# Altium schematic sheet Power.SchDoc
size A4; SheetNumber: 3; SheetTotal: 7
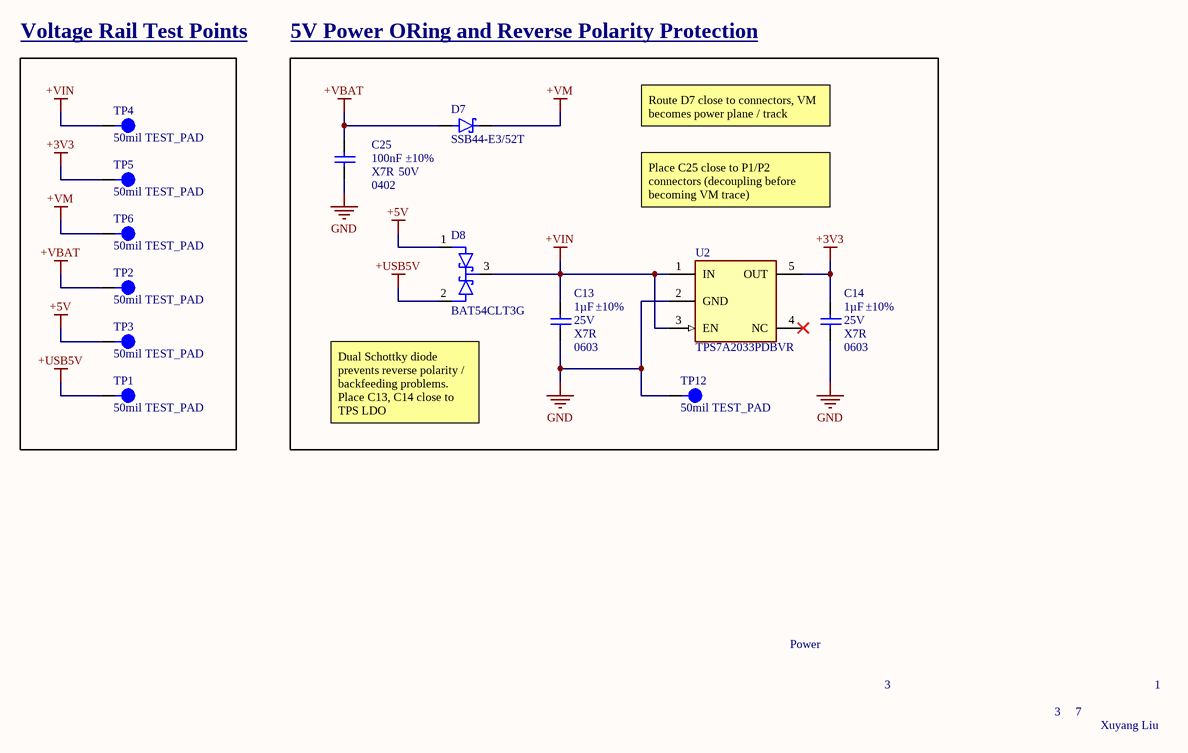
[diagram p0: Power.SchDoc]

## Parts
C13  Voltage: 25V  Tolerance: ±10%  Dielectric: X7R  Case/Package: 0603  Capacitance: 1µF  [0603_CAP]  (hidden comment: 1uF)
C14  Voltage: 25V  Tolerance: ±10%  Dielectric: X7R  Case/Package: 0603  Capacitance: 1µF  [0603_CAP]  (hidden comment: 1uF)
C25  Case/Package: 0402  Voltage Rating: 50V  Dielectric: X7R  Tolerance: ±10%  [0402_Cap]  (hidden comment: 100nF)
D7  SSB44-E3/52T  [DIODE_DO214AA_MBRS_VIS-M]
D8  BAT54CLT3G  [ONSC-SOT-23-3-318-08_V]
TP1  50mil TEST_PAD  [15mil_TEST_PAD]
TP2  50mil TEST_PAD  [15mil_TEST_PAD]
TP3  50mil TEST_PAD  [15mil_TEST_PAD]
TP4  50mil TEST_PAD  [15mil_TEST_PAD]
TP5  50mil TEST_PAD  [15mil_TEST_PAD]
TP6  50mil TEST_PAD  [15mil_TEST_PAD]
TP12  50mil TEST_PAD  [15mil_TEST_PAD]
U2  TPS7A2033PDBVR  [FP-DBV0005A-MFG]

## Blocks framed on the sheet
Voltage Rail Test Points: TP1-TP6
5V Power ORing and Reverse Polarity Protection: C13 C14 C25 D7 D8 TP12 U2

## Nets
+3V3: C14.2 TP5.1 U2.5(OUT)
+5V: D8.1(A1) TP3.1
+USB5V: D8.2(A2) TP1.1
+VBAT: C25.2 D7.A TP2.1
+VIN: C13.2 D8.3(K) TP4.1 U2.1(IN) U2.3(EN)
+VM: D7.C TP6.1
GND: C13.1 C14.1 C25.1 TP12.1 U2.2(GND)

Not connected (* = marked no-connect by the designer): U2 4(NC)*

## Notes on the sheet
- Route D7 close to connectors, VM becomes power plane / track
- Place C25 close to P1/P2 connectors (decoupling before becoming VM trace)
- (near D8) Dual Schottky diode prevents reverse polarity / backfeeding problems. Place C13, C14 close to TPS LDO
- Power
- 3
- 3     7
- 1
- Xuyang Liu

## Library data of the parts
C13 C14 = GCM188R71E105KA64D: 25V 1uF X7R ±10% 0603 Multilayer Ceramic Capacitors MLCC - SMD/SMT ROHS; Manufacturer: Murata; Manufacturer Lifecycle Status: IN PRODUCTION; Supplier 1: DigiKey; Manufacturer Part Number: GCM188R71E105KA64D; RoHS: Compliant; Category: Ceramic Capacitors; Stock 1: 751115; Pricing 1: 1=0.19, 10=0.106, 50=0.0752, 100=0.0658, 500=0.04994, 1000=0.04504 (USD); Case Code (Imperial): 0603; Case Code (Metric): 1608; Country of Origin: Philippines; Depth: 800µm; Dielectric Material: Ceramic; Export Control Classification Number (ECCN) Code: EAR99; Height: 800µm; Harmonized Tariff Schedule (HTS) Code: 8532.24.00.20; Introduction Date: 2010-10-29; Lead Free: Lead Free; Length: 1.6mm; Lifecycle Status: Production; Material: Ceramic; Max Operating Temperature: 125°C; Min Operating Temperature: -55°C; Mount: Surface Mount; Number of Terminals: 2; Packaging: Cut Tape; Radiation Hardening: No; Ratings: AEC-Q200; REACH SVHC: Yes; Schedule B: 8532240020, 8532240020|8532240020, 8532240020|8532240020|8532240020, 8532240020|8532240020|8532240020|8532240020; Termination: SMD/SMT; Voltage Rating: 25V; Voltage Rating (DC): 25V; Weight: 6.293594mg; Width: 800µm; ComponentLink1URL: https://datasheet.octopart.com:443/GCM188R71E105KA64D-Murata-datasheet-39128443.pdf?src-supplier=Newark; ComponentLink1Description: https://datasheet.octopart.com:443/GCM188R71E105KA64D-Murata-datasheet-39128443.pdf?src-supplier=Newark; ComponentLink2URL: https://datasheet.octopart.com:443/GCM188R71E105KA64D-Murata-datasheet-62316951.pdf?src-supplier=element14+APAC; ComponentLink2Description: https://datasheet.octopart.com:443/GCM188R71E105KA64D-Murata-datasheet-62316951.pdf?src-supplier=element14+APAC; ComponentLink3URL: https://datasheet.octopart.com:443/GCM188R71E105KA64D-Murata-datasheet-141267554.pdf?src-supplier=Geoflip; ComponentLink3Description: https://datasheet.octopart.com:443/GCM188R71E105KA64D-Murata-datasheet-141267554.pdf?src-supplier=Geoflip; ComponentLink4URL: https://datasheet.octopart.com:443/GCM188R71E105KA64D-Murata-datasheet-140658666.pdf?src-supplier=Ciiva; ComponentLink4Description: https://datasheet.octopart.com:443/GCM188R71E105KA64D-Murata-datasheet-140658666.pdf?src-supplier=Ciiva; ComponentLink5URL: https://datasheet.octopart.com:443/GCM188R71E105KA64D-Murata-datasheet-138718232.pdf?src-supplier=Ciiva; ComponentLink5Description: https://datasheet.octopart.com:443/GCM188R71E105KA64D-Murata-datasheet-138718232.pdf?src-supplier=Ciiva; ComponentLink6URL: https://datasheet.octopart.com:443/GCM188R71E105KA64D-Murata-datasheet-81455541.pdf?src-supplier=TME; ComponentLink6Description: https://datasheet.octopart.com:443/GCM188R71E105KA64D-Murata-datasheet-81455541.pdf?src-supplier=TME; ComponentLink7URL: https://datasheet.octopart.com/GCM188R71E105KA64D-Murata-datasheet-14404430.pdf; ComponentLink7Description: https://datasheet.octopart.com/GCM188R71E105KA64D-Murata-datasheet-14404430.pdf; ComponentLink8URL: https://datasheet.octopart.com:443/GCM188R71E105KA64D-Murata-datasheet-14393380.pdf?src-supplier=Future+Electronics; ComponentLink8Description: https://datasheet.octopart.com:443/GCM188R71E105KA64D-Murata-datasheet-14393380.pdf?src-supplier=Future+Electronics; ComponentLink9URL: https://datasheet.octopart.com:443/GCM188R71E105KA64D-Murata-datasheet-44103482.pdf?src-supplier=Future+Electronics; ComponentLink9Description: https://datasheet.octopart.com:443/GCM188R71E105KA64D-Murata-datasheet-44103482.pdf?src-supplier=Future+Electronics; ComponentLink10URL: http://sigma.octopart.com:80/reach_statement/Murata-company-16.pdf?src-supplier=Compliance+Statements; ComponentLink10Description: http://sigma.octopart.com:80/reach_statement/Murata-company-16.pdf?src-supplier=Compliance+Statements; Supplier Part Number 1: 490-10673-1-ND
C25 = GCM155R71H104KE02J: 50V 100nF X7R ±10% 0402 Multilayer Ceramic Capacitors MLCC - SMD/SMT ROHS; Manufacturer: Murata; Manufacturer Lifecycle Status: IN PRODUCTION; Supplier 1: DigiKey; Manufacturer Part Number: GCM155R71H104KE02J; RoHS: Compliant; Category: Ceramic Capacitors; Stock 1: 13930662; Pricing 1: 1=0.1, 10=0.034, 50=0.0226, 100=0.0193, 500=0.01374, 1000=0.01205, 2500=0.01027, 5000=0.0092 (USD); Case Code (Imperial): 0402; Case Code (Metric): 1005; Country of Origin: Philippines; Dielectric Material: Ceramic; Export Control Classification Number (ECCN) Code: EAR99; Height: 500µm; Harmonized Tariff Schedule (HTS) Code: 8532.24.00.20; Introduction Date: 2013-11-20; Length: 1mm; Lifecycle Status: Production; Material: Ceramic; Max Operating Temperature: 125°C; Min Operating Temperature: -55°C; Mount: Surface Mount; Number of Terminals: 2; Packaging: Tape & Reel (TR); Ratings: AEC-Q200; REACH SVHC: Yes; Schedule B: 8532240020, 8532240020|8532240020, 8532240020|8532240020|8532240020, 8532240020|8532240020|8532240020|8532240020; Termination: SMD/SMT; Voltage Rating (DC): 50V; Weight: 6.010099mg; Width: 500µm; ComponentLink1URL: https://datasheet.octopart.com:443/GCM155R71H104KE02J-Murata-datasheet-155345015.pdf?src-supplier=Newark; ComponentLink1Description: https://datasheet.octopart.com:443/GCM155R71H104KE02J-Murata-datasheet-155345015.pdf?src-supplier=Newark; ComponentLink2URL: https://datasheet.octopart.com:443/GCM155R71H104KE02J-Murata-datasheet-178519985.pdf?src-supplier=Arrow.cn; ComponentLink2Description: https://datasheet.octopart.com:443/GCM155R71H104KE02J-Murata-datasheet-178519985.pdf?src-supplier=Arrow.cn; ComponentLink3URL: https://datasheet.octopart.com:443/GCM155R71H104KE02J-Murata-datasheet-141266224.pdf?src-supplier=Ciiva; ComponentLink3Description: https://datasheet.octopart.com:443/GCM155R71H104KE02J-Murata-datasheet-141266224.pdf?src-supplier=Ciiva; ComponentLink4URL: https://datasheet.octopart.com:443/GCM155R71H104KE02J-Murata-datasheet-140656751.pdf?src-supplier=Ciiva; ComponentLink4Description: https://datasheet.octopart.com:443/GCM155R71H104KE02J-Murata-datasheet-140656751.pdf?src-supplier=Ciiva; ComponentLink5URL: https://datasheet.octopart.com:443/GCM155R71H104KE02J-Murata-datasheet-138716456.pdf?src-supplier=Ciiva; ComponentLink5Description: https://datasheet.octopart.com:443/GCM155R71H104KE02J-Murata-datasheet-138716456.pdf?src-supplier=Ciiva; ComponentLink6URL: https://datasheet.octopart.com:443/GCM155R71H104KE02J-Murata-datasheet-77992203.pdf?src-supplier=Future+Electronics; ComponentLink6Description: https://datasheet.octopart.com:443/GCM155R71H104KE02J-Murata-datasheet-77992203.pdf?src-supplier=Future+Electronics; ComponentLink7URL: https://datasheet.octopart.com:443/GCM155R71H104KE02J-Murata-datasheet-12511495.pdf?src-supplier=TME; ComponentLink7Description: https://datasheet.octopart.com:443/GCM155R71H104KE02J-Murata-datasheet-12511495.pdf?src-supplier=TME; ComponentLink8URL: http://sigma.octopart.com:80/reach_statement/Murata-company-16.pdf?src-supplier=Compliance+Statements; ComponentLink8Description: http://sigma.octopart.com:80/reach_statement/Murata-company-16.pdf?src-supplier=Compliance+Statements; Supplier Part Number 1: 490-14514-6-ND; Capacitance: 100nF
D7 = SSB44-E3/52T: Schottky diode forward voltage drop (Vf) 490mV@4A DC reverse withstand voltage (Vr) 40V; Manufacturer: Vishay; Average Rectified Current: 4A; Element Configuration: Single; Forward Voltage: 420mV; Max Forward Surge Current (Ifsm): 100A; Max Junction Temperature (Tj): 150°C; Max Reverse Leakage Current: 400µA; Number of Elements: 1; Polarity: Standard; Supplier 1: DigiKey; Manufacturer Part Number: SSB44-E3/52T; RoHS: Compliant; Category: Schottky Diodes; Stock 1: 92846; Pricing 1: 1=0.84, 10=0.52, 100=0.3353 (USD); Case/Package: SMB; China RoHS: Non-Compliant; Contact Plating: Tin; Current Rating: 4A; Forward Current: 4A; Height: 2.44mm; Lead Free: Lead Free; Length: 4.5466mm; Lifecycle Status: Production; Max Operating Temperature: 150°C; Max Output Current: 4A; Max Repetitive Reverse Voltage (Vrrm): 40V; Max Reverse Voltage (DC): 40V; Max Surge Current: 100A; Manufacturer Package Identifier: SSB44-E3/52T; Min Operating Temperature: -65°C; Mount: Surface Mount; Number of Pins: 2; Number of Terminals: 2; Output Current: 4A; Packaging: Cut Tape; Peak Non-Repetitive Surge Current: 100A; Peak Reverse Current: 400µA; Radiation Hardening: No; REACH SVHC: No; Reverse Standoff Voltage: 40V; Schedule B: 8541100080, 8541100080|8541100080|8541100080|8541100080|8541100080; Voltage Rating (DC): 40V; ComponentLink1URL: https://datasheet.octopart.com:443/SSB44-E3-52T-Vishay-datasheet-181475158.pdf?src-supplier=Newark; ComponentLink1Description: https://datasheet.octopart.com:443/SSB44-E3-52T-Vishay-datasheet-181475158.pdf?src-supplier=Newark; ComponentLink2URL: https://datasheet.octopart.com:443/SSB44-E3-52T-Vishay-datasheet-11777709.pdf?src-supplier=Newark; ComponentLink2Description: https://datasheet.octopart.com:443/SSB44-E3-52T-Vishay-datasheet-11777709.pdf?src-supplier=Newark; ComponentLink3URL: https://datasheet.octopart.com:443/SSB44-E3-52T-Vishay-datasheet-10060009.pdf?src-supplier=Newark; ComponentLink3Description: https://datasheet.octopart.com:443/SSB44-E3-52T-Vishay-datasheet-10060009.pdf?src-supplier=Newark; ComponentLink4URL: https://datasheet.octopart.com:443/SSB44-E3-52T-Vishay-datasheet-8331249.pdf?src-supplier=Newark; ComponentLink4Description: https://datasheet.octopart.com:443/SSB44-E3-52T-Vishay-datasheet-8331249.pdf?src-supplier=Newark; ComponentLink5URL: https://datasheet.octopart.com:443/SSB44-E3-52T-Vishay-datasheet-22977460.pdf?src-supplier=Newark; ComponentLink5Description: https://datasheet.octopart.com:443/SSB44-E3-52T-Vishay-datasheet-22977460.pdf?src-supplier=Newark; ComponentLink6URL: https://datasheet.octopart.com:443/SSB44-E3-52T-Vishay-datasheet-21270664.pdf?src-supplier=Newark; ComponentLink6Description: https://datasheet.octopart.com:443/SSB44-E3-52T-Vishay-datasheet-21270664.pdf?src-supplier=Newark; ComponentLink7URL: https://datasheet.octopart.com:443/SSB44-E3-52T-Vishay-datasheet-46750820.pdf?src-supplier=Upverter; ComponentLink7Description: https://datasheet.octopart.com:443/SSB44-E3-52T-Vishay-datasheet-46750820.pdf?src-supplier=Upverter; ComponentLink8URL: https://sigma.octopart.com:443/138898578/technical_drawing/Vishay-SSB44-E3-52T.pdf?src-supplier=Upverter; ComponentLink8Description: https://sigma.octopart.com:443/138898578/technical_drawing/Vishay-SSB44-E3-52T.pdf?src-supplier=Upverter; ComponentLink9URL: https://datasheet.octopart.com:443/SSB44-E3-52T-Vishay-datasheet-62319260.pdf?src-supplier=element14+APAC; ComponentLink9Description: https://datasheet.octopart.com:443/SSB44-E3-52T-Vishay-datasheet-62319260.pdf?src-supplier=element14+APAC; ComponentLink10URL: https://datasheet.octopart.com:443/SSB44-E3-52T-Vishay-datasheet-54005.pdf?src-supplier=element14+APAC; ComponentLink10Description: https://datasheet.octopart.com:443/SSB44-E3-52T-Vishay-datasheet-54005.pdf?src-supplier=element14+APAC; ComponentLink11URL: https://datasheet.octopart.com:443/SSB44-E3/52T-Vishay-datasheet-14186728.pdf?src-supplier=iiiC; ComponentLink11Description: https://datasheet.octopart.com:443/SSB44-E3/52T-Vishay-datasheet-14186728.pdf?src-supplier=iiiC; ComponentLink12URL: https://datasheet.octopart.com:443/SSB44-E3/52T-Vishay-datasheet-9732905.pdf?src-supplier=RS+(Formerly+Allied+Electronics); ComponentLink12Description: https://datasheet.octopart.com:443/SSB44-E3/52T-Vishay-datasheet-9732905.pdf?src-supplier=RS+(Formerly+Allied+Electronics); ComponentLink13URL: https://datasheet.octopart.com:443/SSB44-E3-52T-Vishay-datasheet-7601381.pdf?src-supplier=Jameco; ComponentLink13Description: https://datasheet.octopart.com:443/SSB44-E3-52T-Vishay-datasheet-7601381.pdf?src-supplier=Jameco; ComponentLink14URL: https://datasheet.octopart.com:443/SSB44-E3/52T-Vishay-datasheet-128407.pdf?src-supplier=DigiKey; ComponentLink14Description: https://datasheet.octopart.com:443/SSB44-E3/52T-Vishay-datasheet-128407.pdf?src-supplier=DigiKey; ComponentLink15URL: http://sigma.octopart.com:80/rohs_statement/Vishay-company-15.pdf?src-supplier=Compliance+Statements; ComponentLink15Description: http://sigma.octopart.com:80/rohs_statement/Vishay-company-15.pdf?src-supplier=Compliance+Statements; Supplier Part Number 1: SSB44-E3/52TGICT-ND
D8 = BAT54CLT3G: BAT54CL Series 30 V 2 uA Surface Mount Schottky Barrier Diode - SOT-23; Manufacturer: onsemi; Manufacturer Lifecycle Status: ACTIVE; Average Rectified Current: 200mA; Element Configuration: Common Cathode; Forward Voltage: 240mV; Max Forward Surge Current (Ifsm): 600mA; Max Output Current: 100mA; Max Power Dissipation: 225mW; Max Repetitive Reverse Voltage (Vrrm): 30V; Max Reverse Leakage Current: 2µA; Number of Elements: 2; Recovery Time: 5ns; Supplier 1: DigiKey; Manufacturer Part Number: BAT54CLT3G; RoHS: Compliant; Category: Schottky Diodes; Stock 1: 167313; Pricing 1: 1=0.13, 10=0.081, 100=0.0499, 500=0.036, 1000=0.03147, 2000=0.02764, 5000=0.02347 (USD); Case/Package: SOT-23-3; China RoHS: Compliant; Contact Plating: Tin; Forward Current: 200mA; Halogen Free: Halogen Free; Height: 1.01mm; Lead Free: Lead Free; Length: 3.04mm; Lifecycle Status: Production; Max Operating Temperature: 125°C; Max Reverse Voltage (DC): 30V; Max Surge Current: 600mA; Min Operating Temperature: -55°C; Number of Pins: 3; Number of Terminals: 3; Packaging: Tape and Reel; Peak Non-Repetitive Surge Current: 600mA; Radiation Hardening: No; REACH SVHC: Yes; Reverse Recovery Time: 5ns; Schedule B: 8541100070, 8541100070|8541100070|8541100070|8541100070|8541100070; Width: 1.4mm; ComponentLink1URL: https://datasheet.octopart.com:443/BAT54CLT3G-onsemi-datasheet-175423440.pdf?src-supplier=IHS; ComponentLink1Description: https://datasheet.octopart.com:443/BAT54CLT3G-onsemi-datasheet-175423440.pdf?src-supplier=IHS; ComponentLink2URL: https://datasheet.octopart.com:443/BAT54CLT3G-ON-Semiconductor-datasheet-78758876.pdf?src-supplier=JRH+Electronics; ComponentLink2Description: https://datasheet.octopart.com:443/BAT54CLT3G-ON-Semiconductor-datasheet-78758876.pdf?src-supplier=JRH+Electronics; ComponentLink3URL: https://datasheet.octopart.com:443/BAT54CLT3G-ON-Semiconductor-datasheet-141916634.pdf?src-supplier=Upverter; ComponentLink3Description: https://datasheet.octopart.com:443/BAT54CLT3G-ON-Semiconductor-datasheet-141916634.pdf?src-supplier=Upverter; ComponentLink4URL: https://datasheet.octopart.com:443/BAT54CLT3G-ON-Semiconductor-datasheet-8332005.pdf?src-supplier=Future+Electronics; ComponentLink4Description: https://datasheet.octopart.com:443/BAT54CLT3G-ON-Semiconductor-datasheet-8332005.pdf?src-supplier=Future+Electronics; ComponentLink5URL: https://datasheet.octopart.com:443/BAT54CLT3G-ON-Semiconductor-datasheet-8106935.pdf?src-supplier=Future+Electronics; ComponentLink5Description: https://datasheet.octopart.com:443/BAT54CLT3G-ON-Semiconductor-datasheet-8106935.pdf?src-supplier=Future+Electronics; ComponentLink6URL: https://datasheet.octopart.com:443/BAT54CLT3G-ON-Semiconductor-datasheet-41525499.pdf?src-supplier=RS+(Formerly+Allied+Electronics); ComponentLink6Description: https://datasheet.octopart.com:443/BAT54CLT3G-ON-Semiconductor-datasheet-41525499.pdf?src-supplier=RS+(Formerly+Allied+Electronics); ComponentLink7URL: https://datasheet.octopart.com:443/BAT54CLT3G-onsemi-datasheet-189128037.pdf?src-supplier=Master+Electronics; ComponentLink7Description: https://datasheet.octopart.com:443/BAT54CLT3G-onsemi-datasheet-189128037.pdf?src-supplier=Master+Electronics; ComponentLink8URL: https://datasheet.octopart.com:443/BAT54CLT3G-ON-Semiconductor-datasheet-11629545.pdf?src-supplier=Arrow+Electronics; ComponentLink8Description: https://datasheet.octopart.com:443/BAT54CLT3G-ON-Semiconductor-datasheet-11629545.pdf?src-supplier=Arrow+Electronics; ComponentLink9URL: http://sigma.octopart.com:80/15540786/rohs_certificate/ON-Semiconductor-BAT54CLT3G.pdf?src-supplier=Compliance+Statements; ComponentLink9Description: http://sigma.octopart.com:80/15540786/rohs_certificate/ON-Semiconductor-BAT54CLT3G.pdf?src-supplier=Compliance+Statements; ComponentLink10URL: http://sigma.octopart.com:80/15674214/materials_sheet/ON-Semiconductor-BAT54CLT3G.csv?src-supplier=Compliance+Statements; ComponentLink10Description: http://sigma.octopart.com:80/15674214/materials_sheet/ON-Semiconductor-BAT54CLT3G.csv?src-supplier=Compliance+Statements; ComponentLink11URL: http://sigma.octopart.com:80/150604010/rohs_statement/ON-Semiconductor-BAT54CLT3G.pdf?src-supplier=Compliance+Statements; ComponentLink11Description: http://sigma.octopart.com:80/150604010/rohs_statement/ON-Semiconductor-BAT54CLT3G.pdf?src-supplier=Compliance+Statements; ComponentLink12URL: http://sigma.octopart.com:80/reach_statement/ON-Semiconductor-company-79.pdf?src-supplier=Compliance+Statements; ComponentLink12Description: http://sigma.octopart.com:80/reach_statement/ON-Semiconductor-company-79.pdf?src-supplier=Compliance+Statements; ComponentLink13URL: https://octopart.com:443/opatz8j6/c1?t=fWwoKikT5261mXGM0ypy0g0IGQzQcDddsSZuvbSVdmB-1nZSRZ4ggwUKqIc0QYATxiN1QNv3tc5K9gNLWSsypfRmlmmLl0CvTb6IWTPcR-jy4ZtU7iJlv7LHrjajWQE2jihf16JKVcuOV1nA2-N-excMr1_B4nLS4kXG99ZhUnnRORXzXCD22yMfTlIHVWxdWHuIGrDRLRfDN_FEl5iESrFYiOS-fWRa5LxuqDiveXSQWuYMoy0mSfHtN-TtcfG_yO7Nd7kaCwpBKZqOkFRn_ARKtZBKqK2rNXBFzcF_wkdg0CPJ3JBCCd0-fzEpMgisCGH-zXoAjZ7-YzxmcgmCGNIVYquym6vDa-BdygE&src-supplier=Compliance+Statements; ComponentLink13Description: https://octopart.com:443/opatz8j6/c1?t=fWwoKikT5261mXGM0ypy0g0IGQzQcDddsSZuvbSVdmB-1nZSRZ4ggwUKqIc0QYATxiN1QNv3tc5K9gNLWSsypfRmlmmLl0CvTb6IWTPcR-jy4ZtU7iJlv7LHrjajWQE2jihf16JKVcuOV1nA2-N-excMr1_B4nLS4kXG99ZhUnnRORXzXCD22yMfTlIHVWxdWHuIGrDRLRfDN_FEl5iESrFYiOS-fWRa5LxuqDiveXSQWuYMoy0mSfHtN-TtcfG_yO7Nd7kaCwpBKZqOkFRn_ARKtZBKqK2rNXBFzcF_wkdg0CPJ3JBCCd0-fzEpMgisCGH-zXoAjZ7-YzxmcgmCGNIVYquym6vDa-BdygE&src-supplier=Compliance+Statements; ComponentLink14URL: https://octopart.com:443/opatz8j6/c1?t=B_1W9NDPKiVW9_xeBhSjXW6qpRFQt1GubKuBeL6C7KMWiDqOWuxbkOIcp9dqtX3Yq8--5XW88lfGBVA7HmD66DFyQvDNcrrPjWXZiG4711EOeHHnHpPqwc95_S4fQme7yE9n3sYxdAQvxBXSm4yRVJ71c-OpzKpAJ6ywCVT0a0sKLuIcOVcaIgD61fZtF_LS1kcCDjRxNYrL9WJZcGi5NptJxef-JqYkGUKDfcFHMGi1KZqXCgPZbgxa-Fw5LZxpHp3-6aQwXylQzVvUqX6mobR1Vl3H8PpiMaQjr6OwzEQ9egeKJpLqUcsu08VRy-SY_uHfFQyy3GilZ_cbGYiHirfBU5Mi5EnID-Ym-OKf&src-supplier=Compliance+Statements; ComponentLink14Description: https://octopart.com:443/opatz8j6/c1?t=B_1W9NDPKiVW9_xeBhSjXW6qpRFQt1GubKuBeL6C7KMWiDqOWuxbkOIcp9dqtX3Yq8--5XW88lfGBVA7HmD66DFyQvDNcrrPjWXZiG4711EOeHHnHpPqwc95_S4fQme7yE9n3sYxdAQvxBXSm4yRVJ71c-OpzKpAJ6ywCVT0a0sKLuIcOVcaIgD61fZtF_LS1kcCDjRxNYrL9WJZcGi5NptJxef-JqYkGUKDfcFHMGi1KZqXCgPZbgxa-Fw5LZxpHp3-6aQwXylQzVvUqX6mobR1Vl3H8PpiMaQjr6OwzEQ9egeKJpLqUcsu08VRy-SY_uHfFQyy3GilZ_cbGYiHirfBU5Mi5EnID-Ym-OKf&src-supplier=Compliance+Statements; Supplier Part Number 1: BAT54CLT3GOSDKR-ND
TP1-TP6 TP12 = 15mil TEST_PAD
U2 = TPS7A2033PDBVR: 300mA ultra-low-noise low-IQ low-dropout (LDO) linear regulator with high PSRR 5-SOT-23 -40 to 125; Manufacturer: Texas Instruments; Manufacturer Lifecycle Status: ACTIVE; Accuracy: 1.5%; Dropout Voltage: 145mV; Max Junction Temperature (Tj): 125°C; Max Supply Voltage: 6V; Min Supply Voltage: 1.6V; Nominal Supply Current: 6.5µA; Number of Channels: 1; Output Voltage: 3.3V; Supplier 1: DigiKey; Manufacturer Part Number: TPS7A2033PDBVR; RoHS: Compliant; Category: LDO Voltage Regulators; Stock 1: 57995; Pricing 1: 1=0.33, 10=0.225, 25=0.1992, 100=0.1715, 250=0.15828, 500=0.15028, 1000=0.14369 (USD); Case/Package: SOT-23-5; Height: 1.45mm; Length: 2.9mm; Lifecycle Status: Production; Max Operating Temperature: 125°C; Min Operating Temperature: -40°C; Number of Outputs: 1; Number of Pins: 5; Output Current: 300mA; Thickness: 1.2mm; Width: 1.6mm; ComponentLink1URL: https://sigma.octopart.com:443/177332311/technical_drawing/Texas-Instruments-TPS7A2033PDBVR.pdf?src-supplier=Texas+Instruments; ComponentLink1Description: https://sigma.octopart.com:443/177332311/technical_drawing/Texas-Instruments-TPS7A2033PDBVR.pdf?src-supplier=Texas+Instruments; ComponentLink2URL: https://octopart.com:443/opatz8j6/c1?t=jI4MJxUHNHWPLUTUjPFE_I4nFT9ogQQS70wFg6iEODFO8LbYHvqBDKPBMlDtEwO4fNGI88ubVwCkCjf0m79oYyvw0lNgXSr_kQlB_nshs-lDL0gpQEt062WpfwVbrY7aMcaNfk_VYcVu1c5ZyMHT8tYLznoJcMs0V3cIKOpV8FkTUbmZxBhaArT7MSQXB5rB175PQ9HeqkODOBcAb5uxQ4pXmdIRVFW0nHjT5bbTxbLCkHYQ6wSbjOTmjpzrmMdRq376bhW5SzS0L0ZYTijf2l1mplZ7KrrI9CUmQvcyMNcVPe6befGlNnr1fDH3Q5Ss6aSm6FD-UpaqOnEuIpR4XaVo6xK0ksEziWk1rzqOuekfSo_fNioOtoDqTgyhaxobMR58zb0N&src-supplier=Texas+Instruments; ComponentLink2Description: https://octopart.com:443/opatz8j6/c1?t=jI4MJxUHNHWPLUTUjPFE_I4nFT9ogQQS70wFg6iEODFO8LbYHvqBDKPBMlDtEwO4fNGI88ubVwCkCjf0m79oYyvw0lNgXSr_kQlB_nshs-lDL0gpQEt062WpfwVbrY7aMcaNfk_VYcVu1c5ZyMHT8tYLznoJcMs0V3cIKOpV8FkTUbmZxBhaArT7MSQXB5rB175PQ9HeqkODOBcAb5uxQ4pXmdIRVFW0nHjT5bbTxbLCkHYQ6wSbjOTmjpzrmMdRq376bhW5SzS0L0ZYTijf2l1mplZ7KrrI9CUmQvcyMNcVPe6befGlNnr1fDH3Q5Ss6aSm6FD-UpaqOnEuIpR4XaVo6xK0ksEziWk1rzqOuekfSo_fNioOtoDqTgyhaxobMR58zb0N&src-supplier=Texas+Instruments; ComponentLink3URL: https://sigma.octopart.com:443/175570406/technical_drawing/Texas-Instruments-TPS7A2033PDBVR.pdf?src-supplier=Texas+Instruments; ComponentLink3Description: https://sigma.octopart.com:443/175570406/technical_drawing/Texas-Instruments-TPS7A2033PDBVR.pdf?src-supplier=Texas+Instruments; ComponentLink4URL: https://sigma.octopart.com:443/169406034/technical_drawing/Texas-Instruments-TPS7A2033PDBVR.pdf?src-supplier=Texas+Instruments; ComponentLink4Description: https://sigma.octopart.com:443/169406034/technical_drawing/Texas-Instruments-TPS7A2033PDBVR.pdf?src-supplier=Texas+Instruments; ComponentLink5URL: https://sigma.octopart.com:443/155939316/technical_drawing/Texas-Instruments-TPS7A2033PDBVR.pdf?src-supplier=Texas+Instruments; ComponentLink5Description: https://sigma.octopart.com:443/155939316/technical_drawing/Texas-Instruments-TPS7A2033PDBVR.pdf?src-supplier=Texas+Instruments; ComponentLink6URL: https://datasheet.octopart.com:443/TPS7A2033PDBVR-Texas-Instruments-datasheet-149070019.pdf?src-supplier=Upverter; ComponentLink6Description: https://datasheet.octopart.com:443/TPS7A2033PDBVR-Texas-Instruments-datasheet-149070019.pdf?src-supplier=Upverter; ComponentLink7URL: https://datasheet.octopart.com:443/TPS7A2033PDBVR-Texas-Instruments-datasheet-164420832.pdf?src-supplier=Augswan; ComponentLink7Description: https://datasheet.octopart.com:443/TPS7A2033PDBVR-Texas-Instruments-datasheet-164420832.pdf?src-supplier=Augswan; ComponentLink8URL: https://datasheet.octopart.com:443/TPS7A2033PDBVR-Texas-Instruments-datasheet-159781690.pdf?src-supplier=LCSC; ComponentLink8Description: https://datasheet.octopart.com:443/TPS7A2033PDBVR-Texas-Instruments-datasheet-159781690.pdf?src-supplier=LCSC; ComponentLink9URL: http://sigma.octopart.com:80/reach_statement/Texas-Instruments-company-64.pdf?src-supplier=Compliance+Statements; ComponentLink9Description: http://sigma.octopart.com:80/reach_statement/Texas-Instruments-company-64.pdf?src-supplier=Compliance+Statements; ComponentLink10URL: http://sigma.octopart.com:80/conflict_mineral_statement/Texas-Instruments-company-63.pdf?src-supplier=Compliance+Statements; ComponentLink10Description: http://sigma.octopart.com:80/conflict_mineral_statement/Texas-Instruments-company-63.pdf?src-supplier=Compliance+Statements; Supplier Part Number 1: 296-TPS7A2033PDBVRDKR-ND